# Altium project GEMAS-Guereca Entertainment Mini Arcade System.PrjPcb
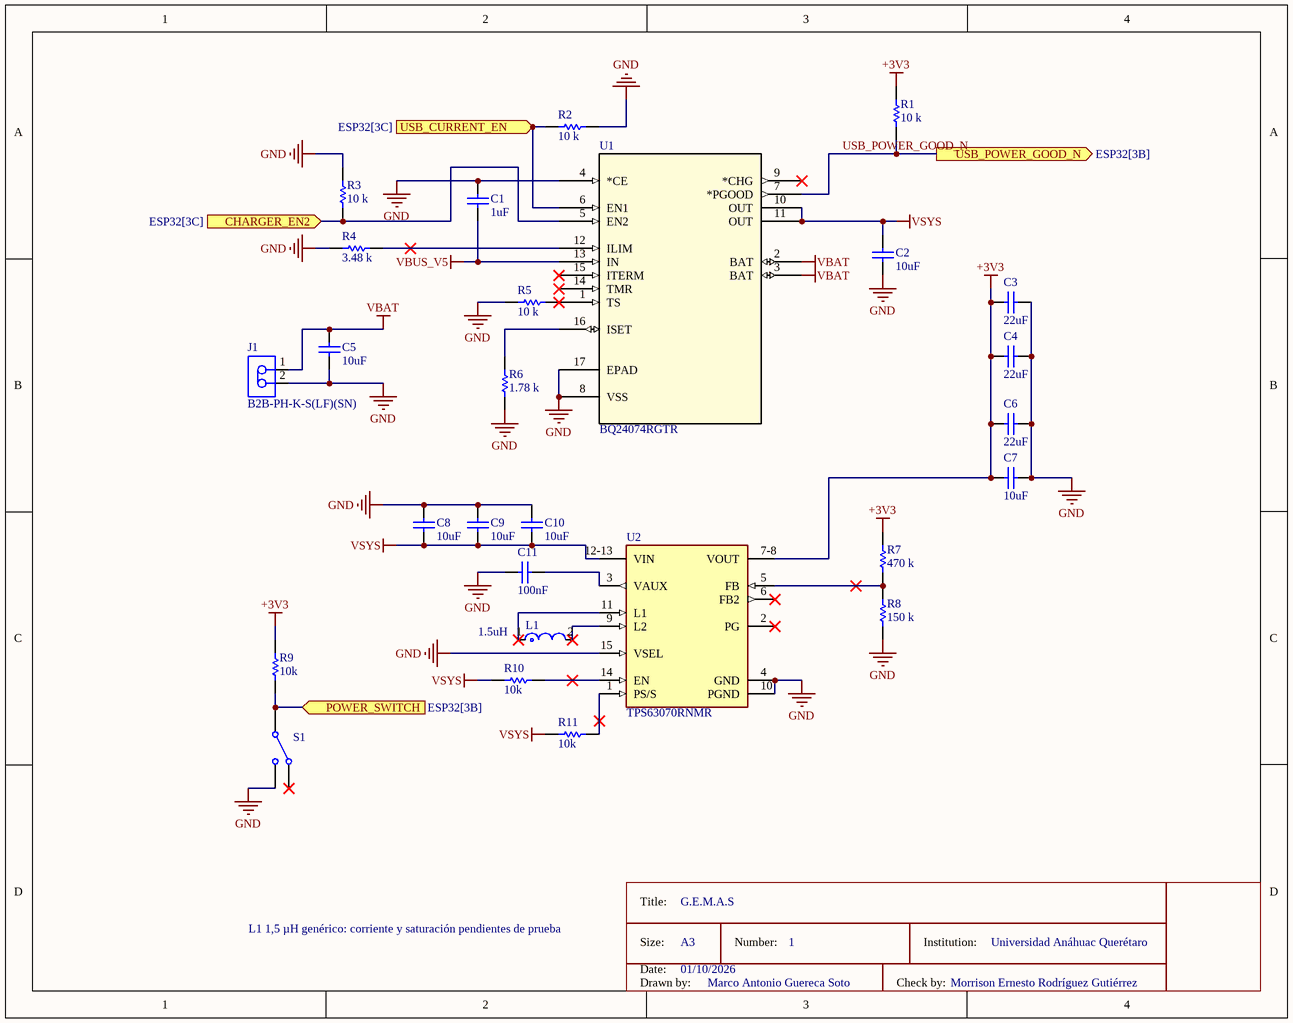
[diagram p0: Alimentacion.SchDoc]
6 sheets, 89 parts. Net scope: global (net labels, ports and power ports of the same name join across sheets).
Board files: PCB_Gemas.PcbDoc, PCB_GEMAS1.1.PcbDoc, PCB_GEMAS_V2(RevisaEsta).PcbDoc
Sheets:
  Alimentacion.SchDoc
  USB-C.SchDoc
  ESP32.SchDoc
  Pantalla_microSD.SchDoc
  Audio.SchDoc
  Controles.SchDoc

## Sheet Alimentacion.SchDoc: G.E.M.A.S
size A; Date: 01/10/2026; SheetNumber: 1; SheetTotal: 5

### Parts
C1  value 1uF  [CAP 1206_3216]  (hidden comment: Capacitor)
C2  value 10uF  [CAP 1206_3216]  (hidden comment: Capacitor)
C3  22uF  [CAP 1206_3216]
C4  22uF  [CAP 1206_3216]
C5  value 10uF  [CAP 1206_3216]  (hidden comment: Capacitor)
C6  22uF  [CAP 1206_3216]
C7  value 10uF  [CAP 1206_3216]  (hidden comment: Capacitor)
C8  value 10uF  [CAP 1206_3216]  (hidden comment: Capacitor)
C9  value 10uF  [CAP 1206_3216]  (hidden comment: Capacitor)
C10  value 10uF  [CAP 1206_3216]  (hidden comment: Capacitor)
C11  value 100nF  [CAP 1206_3216]  (hidden comment: Capacitor)
J1  B2B-PH-K-S(LF)(SN)  [JST-B2B-PH-K-S_V]
L1  1.5uH  [FP-XFL4020-MFG]
R1  value 10 k  [RES 0805_2012]  (hidden comment: Resistor)
R2  value 10 k  [RES 0805_2012]  (hidden comment: Resistor)
R3  value 10 k  [RES 0805_2012]  (hidden comment: Resistor)
R4  value 3.48 k  [RES 0805_2012]  (hidden comment: Resistor)
R5  value 10 k  [RES 0805_2012]  (hidden comment: Resistor)
R6  value 1.78 k  [RES 0805_2012]  (hidden comment: Resistor)
R7  value 470 k  [RES 0805_2012]  (hidden comment: Resistor)
R8  value 150 k  [RES 0805_2012]  (hidden comment: Resistor)
R9  value 10k  [RES 0805_2012]  (hidden comment: Resistor)
R10  value 10k  [RES 0805_2012]  (hidden comment: Resistor)
R11  value 10k  [RES 0805_2012]  (hidden comment: Resistor)
S1  Single-Pole, Double-Throw Switch  [1P2T_SS-12D00_CNK]  (value not drawn)
U1  BQ24074RGTR  [RGT16_1P7X1P7]
U2  TPS63070RNMR  [FP-RNM0015A-MFG]

### Ports
CHARGER_EN2 (in, see ESP32[3C]), POWER_SWITCH (in, see ESP32[3B]), USB_CURRENT_EN (in, see ESP32[3C]), USB_POWER_GOOD_N (out, see ESP32[3B])

### Nets
+3V3: C3.1 C4.1 C6.1 C7.1 R1.1 R7.2 R9.1 U2.7-8(VOUT)
GND: C1.2 C2.1 C3.2 C4.2 C5.1 C6.2 C7.2 C8.1 C9.1 C10.1 C11.1 J1.2 R2.1 R3.1 R4.2 R5.2 R6.2 R8.2 S1.2 U1.4(*CE) U1.8(VSS) U1.17(EPAD) U2.4(GND) U2.10(PGND) U2.15(VSEL)
VBAT: C5.2 J1.1 U1.2(BAT) U1.3(BAT)
VBUS_V5: C1.1 U1.13(IN)
VSYS: C2.2 C8.2 C9.2 C10.2 R10.1 R11.1 U1.10(OUT) U1.11(OUT) U2.12-13(VIN)
USB_POWER_GOOD_N: R1.2 U1.7(*PGOOD) ; port USB_POWER_GOOD_N
NetC11_2: C11.2 U2.3(VAUX)
NetL1_1: L1.1 U2.11(L1)
NetL1_2: L1.2 U2.9(L2)
NetR2_2: R2.2 U1.6(EN1) ; port USB_CURRENT_EN
NetR3_2: R3.2 U1.5(EN2) ; port CHARGER_EN2
NetR4_1: R4.1 U1.12(ILIM)
NetR5_1: R5.1 U1.1(TS)
NetR6_1: R6.1 U1.16(ISET)
NetR7_1: R7.1 R8.1 U2.5(FB)
NetR9_2: R9.2 S1.1 ; port POWER_SWITCH
NetR10_2: R10.2 U2.14(EN)
NetR11_2: R11.2 U2.1(PS/S)

Not connected (* = marked no-connect by the designer): S1 3*; U1 9(*CHG)* 14(TMR)* 15(ITERM)*; U2 2(PG)* 6(FB2)*

### Notes on the sheet
- L1 1,5 µH genérico: corriente y saturación pendientes de prueba
- Title:
- Date:
- Size:
- A3
- Number:
- Institution:
- Universidad Anáhuac Querétaro
- Drawn by:
- Marco Antonio Guereca Soto
- Check by:
- Morrison Ernesto Rodríguez Gutiérrez

### Library data of the parts
C1 C2 C5 C7-C11 = Capacitor: SimulationGenericComponent: True
C3 C4 C6 = Capacitor: 22F; SimulationGenericComponent: True; Value: 22uF
J1 = CMP-2000-05162-1: Male Header, Pitch 2 mm, 1 x 2 Position, Height 6 mm, Tail Length 3.4 mm, -25 to 85 degC, RoHS, Bulk; Manufacturer: JST; Pitch: 2mm; Style/Orientation: StraightHeader/Plug; No of Positions: 2; Datasheet Version: Nov-08; Datasheet URL: http://datasheet.octopart.com/B2B-PH-K-S%28LF%29%28SN%29-JST-datasheet-8324864.pdf; Manufacturer URL: http://www.jst.com/home2.html; Type: ShroudedHeader; Termination: Crimp
L1 = CMP-11268-000104-1: Inductor Power Shielded Wirewound 1.5uH 20% 100KHz 9.1A 15.8mOhm DCR 1515 Automotive Embossed Plastic T/R; Core Material: Composite; DC Resistance (DCR): 15.8mR; Saturation Current: 4.1A; Self Resonant Frequency: 59MHz; Tolerance: 20%; Inductance: 1.5uH; Max DC Current: 9.1A; RoHS Compliant: Yes; Max Operating Temperature: 125°C; Length: 4.3mm; Case/Package: SMD/SMT; Mount: Surface Mount; Shielding: Shielded; Min Operating Temperature: -40°C; RMS Current (Irms): 9.1A; Test Frequency: 100kHz; Inductance Tolerance: 20%; REACH SVHC: No SVHC; Packaging: Tape and Reel; Termination: SMD/SMT; Lead Free: Contains Lead; Width: 4.3mm; Series: XFL4020; Height: 2.1mm
R1-R11 = Resistor: TC1: 0; SimulationGenericComponent: True; TC2: 0
S1 = SPDT SW: nodeUP_closed: 1; Rclosed: 1m; Ropen: 1Meg; SimulationGenericComponent: True
U1 = BQ24074RGTR: Standalone 1-cell 1.5-A linear battery charger, Power Path, 4.2-V VBAT, 10.5-V OVP and 4.4-V VOUT 16-VQFN -40 to 85; Manufacturer_Name: Texas Instruments; Copyright: Copyright (C) 2026 Ultra Librarian. All rights reserved.; Manufacturer_Part_Number: BQ24074RGTR; RefDes: RefDes; Type: Type
U2 = CMP-04918-000409-1: IC REG BCK BST ADJ 3.6A 15VQFN; Synchronous Rectifier: Yes; Output Type: Adjustable; Output Current: 2A; Max Input Voltage: 16V; Switching Frequency: 2.4MHz; Min Output Voltage: 2.5V; Output Configuration: Positive; Min Input Voltage: 2V; Topology: Buck-Boost; Number of Outputs: 1; Max Output Voltage: 9V; Quiescent Current: 50uA; Max Operating Temperature: 125°C; Case/Package: VQFN; Number of Pins: 15; RoHS Compliant: Yes; Mount: Surface Mount; Min Operating Temperature: -40°C; Lead Free: Lead Free; Packaging: Tape and Reel

## Sheet USB-C.SchDoc
size A; SheetNumber: 2; SheetTotal: 6
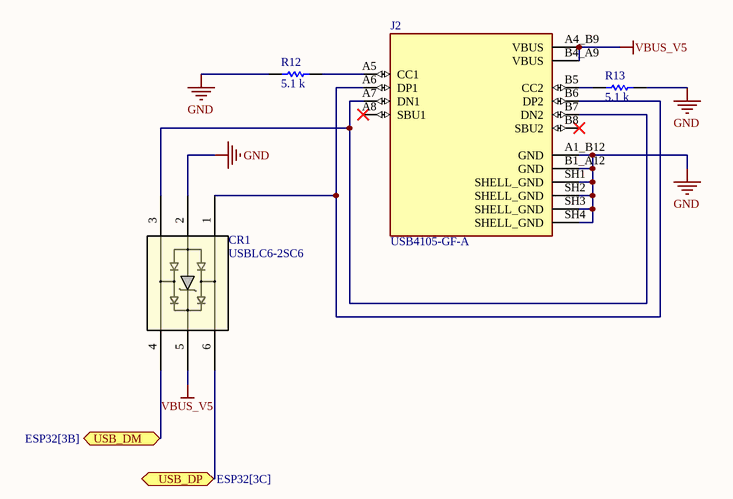
[diagram p1: USB-C.SchDoc]

### Parts
CR1  USBLC6-2SC6  [SOT23-6L_STM]
J2  USB4105-GF-A  [GCT_USB4105-GF-A]
R12  value 5.1 k  [RES 0805_2012]  (hidden comment: Resistor)
R13  value 5.1 k  [RES 0805_2012]  (hidden comment: Resistor)

### Ports
USB_DM (bidir, see ESP32[3B]), USB_DP (bidir, see ESP32[3C])

### Nets
GND: CR1.2 J2.A1_B12(GND) J2.B1_A12(GND) J2.SH1(SHELL_GND) J2.SH2(SHELL_GND) J2.SH3(SHELL_GND) J2.SH4(SHELL_GND) R12.1 R13.2
VBUS_V5: CR1.5 J2.A4_B9(VBUS) J2.B4_A9(VBUS)
NetCR1_1: CR1.1 J2.A6(DP1) J2.B6(DP2)
NetCR1_3: CR1.3 J2.A7(DN1) J2.B7(DN2)
NetCR1_4: CR1.4 ; port USB_DM
NetCR1_6: CR1.6 ; port USB_DP
NetJ2_A5: J2.A5(CC1) R12.2
NetJ2_B5: J2.B5(CC2) R13.1

Not connected (* = marked no-connect by the designer): J2 A8(SBU1)* B8(SBU2)*

### Notes on the sheet
- Title:
- Date:
- Size:
- A3
- Number:
- Institution:
- Universidad Anáhuac Querétaro
- Drawn by:
- Marco Antonio Guereca Soto
- Check by:
- Morrison Ernesto Rodríguez Gutiérrez

### Library data of the parts
CR1 = USBLC6-2SC6: ESD Protection for USB 2.0 High Speed; Manufacturer_Name: STMicroelectronics; Copyright: Copyright (C) 2025 Ultra Librarian. All rights reserved.; Manufacturer_Part_Number: USBLC6-2SC6; RefDes: RefDes; Type: Type
J2 = USB4105-GF-A: MF: {'manufacturer': u'GCT'}; Package: None; Price: None; Value: *; MP: USB4105-GF-A; Availability: Unavailable
R12 R13 = Resistor: TC1: 0; SimulationGenericComponent: True; TC2: 0

## Sheet ESP32.SchDoc
size A; SheetNumber: 3; SheetTotal: 6
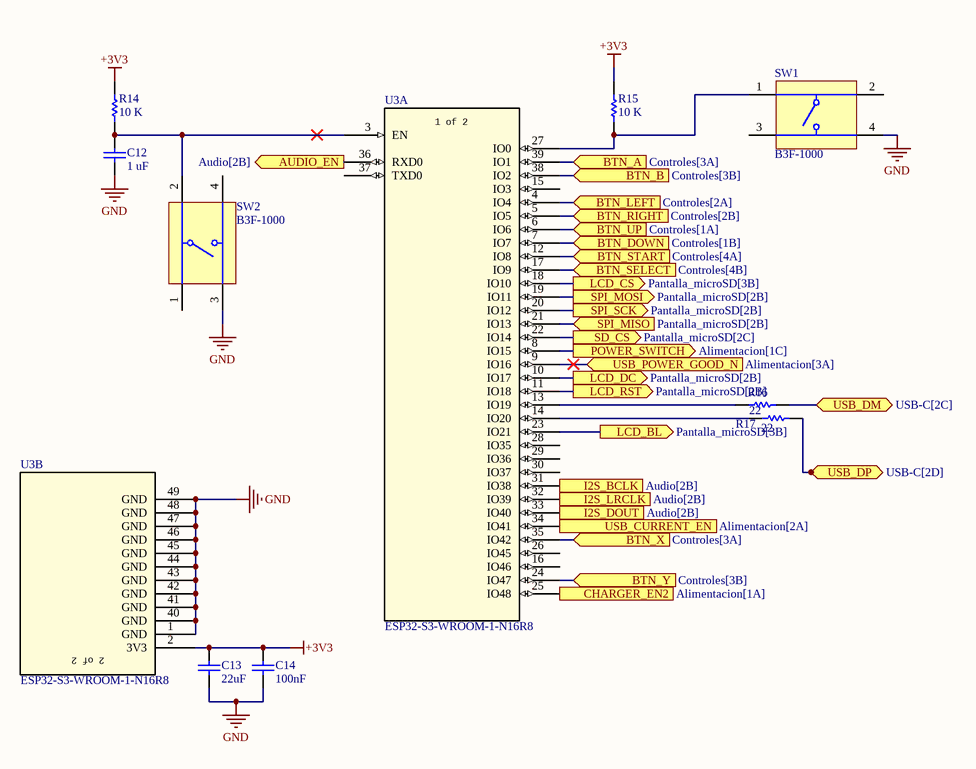
[diagram p2: ESP32.SchDoc]

### Parts
C12  1 uF  [CAP 1206_3216]
C13  value 22uF  [CAP 1206_3216]  (hidden comment: Capacitor)
C14  value 100nF  [CAP 1206_3216]  (hidden comment: Capacitor)
R14  10 k  [RES 0805_2012]
R15  10 k  [RES 0805_2012]
R16  value 22  [RES 0805_2012]  (hidden comment: Resistor)
R17  value 22  [RES 0805_2012]  (hidden comment: Resistor)
SW1  B3F-1000  [OMRON-B3F-1000-4_V]
SW2  B3F-1000  [OMRON-B3F-1000-4_V]
U3  ESP32-S3-WROOM-1-N16R8  [ESP32-S3-WROOM-1_EXP]  (parts A,B of 2)

### Ports
AUDIO_EN (out, see Audio[2B]), BTN_A (in, see Controles[3A]), BTN_B (in, see Controles[3B]), BTN_DOWN (in, see Controles[1B]), BTN_LEFT (in, see Controles[2A]), BTN_RIGHT (in, see Controles[2B]), BTN_SELECT (in, see Controles[4B]), BTN_START (in, see Controles[4A]), BTN_UP (in, see Controles[1A]), BTN_X (in, see Controles[3A]), BTN_Y (in, see Controles[3B]), CHARGER_EN2 (out, see Alimentacion[1A]), I2S_BCLK (out, see Audio[2B]), I2S_DOUT (out, see Audio[2B]), I2S_LRCLK (out, see Audio[2B]), LCD_BL (out, see Pantalla_microSD[3B]), LCD_CS (out, see Pantalla_microSD[3B]), LCD_DC (out, see Pantalla_microSD[2B]), LCD_RST (out, see Pantalla_microSD[2B]), POWER_SWITCH (out, see Alimentacion[1C]), SD_CS (out, see Pantalla_microSD[2C]), SPI_MISO (in, see Pantalla_microSD[2B]), SPI_MOSI (out, see Pantalla_microSD[2B]), SPI_SCK (out, see Pantalla_microSD[2B]), USB_CURRENT_EN (out, see Alimentacion[2A]), USB_DM (bidir, see USB-C[2C]), USB_DP (bidir, see USB-C[2D]), USB_POWER_GOOD_N (in, see Alimentacion[3A])

### Nets
+3V3: C13.2 C14.1 R14.2 R15.2 U3.2(3V3)
GND: C12.1 C13.1 C14.2 SW1.4 SW2.3 U3.1(GND) U3.40(GND) U3.41(GND) U3.42(GND) U3.43(GND) U3.44(GND) U3.45(GND) U3.46(GND) U3.47(GND) U3.48(GND) U3.49(GND)
SPI_MISO: U3.21(IO13) ; port SPI_MISO
SPI_MOSI: U3.19(IO11) ; port SPI_MOSI
SPI_SCK: U3.20(IO12) ; port SPI_SCK
USB_POWER_GOOD_N: U3.9(IO16) ; port USB_POWER_GOOD_N
NetC12_2: C12.2 R14.1 SW2.2 U3.3(EN)
NetCR1_4: R16.2 ; port USB_DM
NetCR1_6: R17.2 ; port USB_DP
NetJ3_2: U3.11(IO18) ; port LCD_RST
NetJ3_4: U3.10(IO17) ; port LCD_DC
NetJ3_5: U3.18(IO10) ; port LCD_CS
NetJ4_2: U3.22(IO14) ; port SD_CS
NetR2_2: U3.34(IO41) ; port USB_CURRENT_EN
NetR3_2: U3.25(IO48) ; port CHARGER_EN2
NetR9_2: U3.8(IO15) ; port POWER_SWITCH
NetR15_1: R15.1 SW1.1 U3.27(IO0)
NetR16_1: R16.1 U3.13(IO19)
NetR17_1: R17.1 U3.14(IO20)
NetR19_1: U3.23(IO21) ; port LCD_BL
NetR30_2: U3.36(RXD0) ; port AUDIO_EN
NetR32_1: U3.6(IO6) ; port BTN_UP
NetR33_1: U3.4(IO4) ; port BTN_LEFT
NetR34_1: U3.39(IO1) ; port BTN_A
NetR35_1: U3.35(IO42) ; port BTN_X
NetR36_1: U3.12(IO8) ; port BTN_START
NetR37_1: U3.7(IO7) ; port BTN_DOWN
NetR38_1: U3.5(IO5) ; port BTN_RIGHT
NetR39_1: U3.38(IO2) ; port BTN_B
NetR40_1: U3.24(IO47) ; port BTN_Y
NetR41_1: U3.17(IO9) ; port BTN_SELECT
NetU3_31: U3.31(IO38) ; port I2S_BCLK
NetU3_32: U3.32(IO39) ; port I2S_LRCLK
NetU3_33: U3.33(IO40) ; port I2S_DOUT

Not connected (* = marked no-connect by the designer): SW1 2 3; SW2 1 4; U3 15(IO3) 16(IO46) 26(IO45) 28(IO35) 29(IO36) 30(IO37) 37(TXD0)

### Notes on the sheet
- Title:
- Date:
- Size:
- A3
- Number:
- Institution:
- Universidad Anáhuac Querétaro
- Drawn by:
- Marco Antonio Guereca Soto
- Check by:
- Morrison Ernesto Rodríguez Gutiérrez
- (in symbol ESP32-S3-WROOM-1-N16R8, part A) 1 of 2
- (in symbol ESP32-S3-WROOM-1-N16R8, part B) 2 of 2

### Library data of the parts
C12-C14 = Capacitor: SimulationGenericComponent: True
  C12: Value: 1 uF
R14-R17 = Resistor: TC1: 0; SimulationGenericComponent: True; TC2: 0
  R14 R15: Value: 10 K
SW1 SW2 = CMP-1677-00002-1: Tactile Switch, SPST-NO, 0.05 A, 5 to 24 V, -25 to 70 degC, 4-Pin THD, RoHS, Bulk; Shielding: Shielded; Gender: Female; Capacitance: -45 f; Voltage Rating: 150 V; Current Rating: 1.5 A; Radiation Hardening: No; Contact Plating: Gold; Height: 14.99 mm; Min Operating Temperature: -40 degC; Packaging: Tray; ComponentLink2Description: Datasheet; ComponentLink1URL: http://www.omron.com/; Lead Pitch: 1.27 mm; RoHSCompliant: true; Pins: 8; PackageReference: B3F-1000; Width: 25.4 mm; Contact Material: Brass; ComponentLink2URL: http://www.omron.com/ecb/products/pdf/en-b3f.pdf; PackageDescription: 4-Pin Through Hole Device, Body 6 x 6 mm; DatasheetVersion: Jan-15; ComponentLink1Description: Manufacturer URL; Package Quantity: 1080; Mount: Through Hole; Length: 18.34 mm; Max Operating Temperature: 70 degC
U3 = ESP32-S3-WROOM-1-N16R8: Description; Manufacturer_Name: Espressif Systems; Copyright: Copyright (C) 2026 Ultra Librarian. All rights reserved.; Manufacturer_Part_Number: ESP32-S3-WROOM-1-N16R8; RefDes: RefDes; Type: Type

## Sheet Pantalla_microSD.SchDoc
size A; SheetNumber: 4; SheetTotal: 6
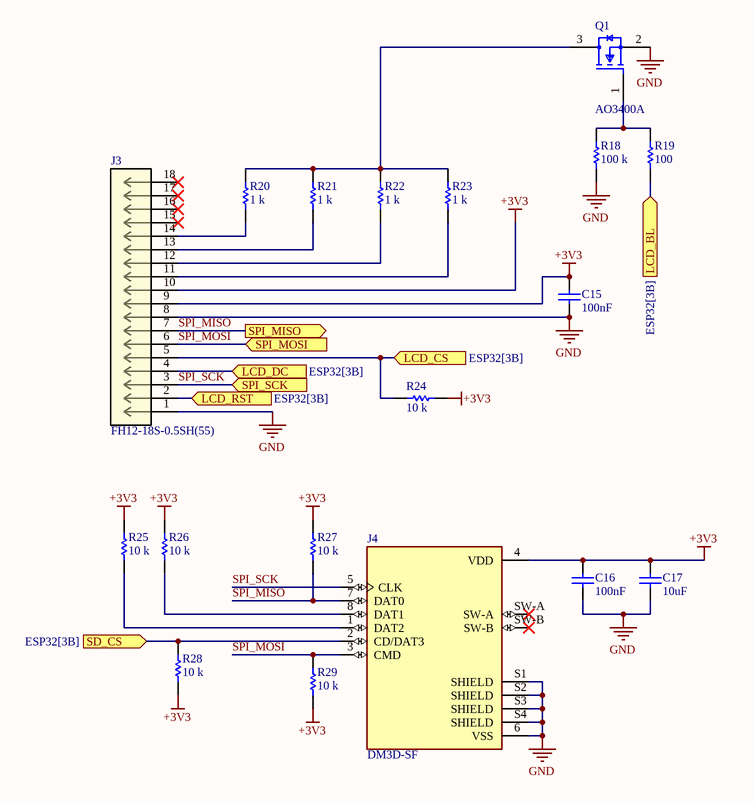
[diagram p3: Pantalla_microSD.SchDoc]

### Parts
C15  value 100nF  [CAP 1206_3216]  (hidden comment: Capacitor)
C16  value 100nF  [CAP 1206_3216]  (hidden comment: Capacitor)
C17  value 10uF  [CAP 1206_3216]  (hidden comment: Capacitor)
J3  FH12-18S-0.5SH(55)  [CONN_FH12-18S-0.5SH-55_HIR]
J4  DM3D-SF  [HRS_DM3D-SF]
Q1  AO3400A  [FP-SOT23-MFG]
R18  value 100 k  [RES 0805_2012]  (hidden comment: Resistor)
R19  value 100  [RES 0805_2012]  (hidden comment: Resistor)
R20  value 1 k  [RES 0805_2012]  (hidden comment: Resistor)
R21  value 1 k  [RES 0805_2012]  (hidden comment: Resistor)
R22  value 1 k  [RES 0805_2012]  (hidden comment: Resistor)
R23  value 1 k  [RES 0805_2012]  (hidden comment: Resistor)
R24  value 10 k  [RES 0805_2012]  (hidden comment: Resistor)
R25  value 10 k  [RES 0805_2012]  (hidden comment: Resistor)
R26  value 10 k  [RES 0805_2012]  (hidden comment: Resistor)
R27  value 10 k  [RES 0805_2012]  (hidden comment: Resistor)
R28  value 10 k  [RES 0805_2012]  (hidden comment: Resistor)
R29  value 10 k  [RES 0805_2012]  (hidden comment: Resistor)

### Ports
LCD_BL (in, see ESP32[3B]), LCD_CS (in, see ESP32[3B]), LCD_DC (in, see ESP32[3B]), LCD_RST (in, see ESP32[3B]), SD_CS (in, see ESP32[3B]), SPI_MISO (out, see ESP32[3B]), SPI_MOSI (in, see ESP32[3B]), SPI_SCK (in, see ESP32[3B])

### Nets
+3V3: C15.2 C16.2 C17.2 J3.9 J3.10 J4.4(VDD) R24.2 R25.1 R26.1 R27.2 R28.2 R29.2
GND: C15.1 C16.1 C17.1 J3.1 J3.8 J4.6(VSS) J4.S1(SHIELD) J4.S2(SHIELD) J4.S3(SHIELD) J4.S4(SHIELD) Q1.2(S) R18.1
SPI_MISO: J3.7 J4.7(DAT0) R27.1 ; port SPI_MISO
SPI_MOSI: J3.6 J4.3(CMD) R29.1 ; port SPI_MOSI
SPI_SCK: J3.3 J4.5(CLK) ; port SPI_SCK
NetJ3_2: J3.2 ; port LCD_RST
NetJ3_4: J3.4 ; port LCD_DC
NetJ3_5: J3.5 R24.1 ; port LCD_CS
NetJ3_11: J3.11 R23.1
NetJ3_12: J3.12 R22.1
NetJ3_13: J3.13 R21.1
NetJ3_14: J3.14 R20.1
NetJ4_1: J4.1(DAT2) R25.2
NetJ4_2: J4.2(CD/DAT3) R28.1 ; port SD_CS
NetJ4_8: J4.8(DAT1) R26.2
NetQ1_1: Q1.1(G) R18.2 R19.2
NetQ1_3: Q1.3(D) R20.2 R21.2 R22.2 R23.2
NetR19_1: R19.1 ; port LCD_BL

Not connected (* = marked no-connect by the designer): J3 15* 16* 17* 18*; J4 SW-A* SW-B*

### Notes on the sheet
- Title:
- Date:
- Size:
- A3
- Number:
- Institution:
- Universidad Anáhuac Querétaro
- Drawn by:
- Marco Antonio Guereca Soto
- Check by:
- Morrison Ernesto Rodríguez Gutiérrez

### Library data of the parts
C15-C17 = Capacitor: SimulationGenericComponent: True
J3 = FH12-18S-0.5SH55: Description; Manufacturer_Name: Hirose; Copyright: Copyright (C) 2026 Ultra Librarian. All rights reserved.; Manufacturer_Part_Number: FH12-18S-0.5SH(55); RefDes: RefDes; Type: Type
J4 = DM3D-SF: 10 _8 + 2_ Position Card Connector Secure Digital - microSDâ„¢ Surface Mount, Right Angle Gold; MF: Hirose Electric; MP: DM3D-SF; Package: None; Price: None; Availability: Unavailable; SnapEDA_Link: https://www.snapeda.com/parts/DM3D-SF/Hirose%20Electric%20Co%20Ltd/view-part/250106/?ref=snap; Value: *
Q1 = CMP-83955-000006-1: MOSFET N-CH 30V 5.7A SOT23; Input Capacitance: 630pF; Number of Elements: 1; Rds On Max: 26.5mR; Max Power Dissipation: 1.4W; Gate to Source Voltage (Vgs): 12V; Min Operating Temperature: -55°C; Lead Free: Lead Free; Number of Pins: 3; Drain to Source Voltage (Vdss): 30V; Case/Package: SOT-23; Mount: Surface Mount; Continuous Drain Current (ID): 5.7A; Radiation Hardening: No; Packaging: Tape and Reel; Max Operating Temperature: 150°C; Power Dissipation: 1.4W
R18-R29 = Resistor: TC1: 0; SimulationGenericComponent: True; TC2: 0

## Sheet Audio.SchDoc
size A; SheetNumber: 5; SheetTotal: 6
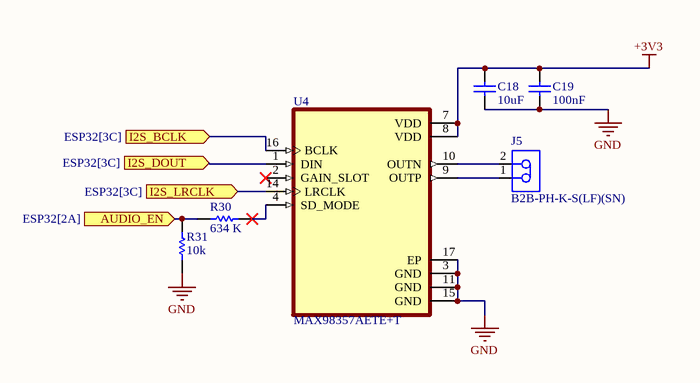
[diagram p4: Audio.SchDoc]

### Parts
C18  value 10uF  [CAP 1206_3216]  (hidden comment: Capacitor)
C19  value 100nF  [CAP 1206_3216]  (hidden comment: Capacitor)
J5  B2B-PH-K-S(LF)(SN)  [JST-B2B-PH-K-S_V]
R30  value 634 K  [RES 0805_2012]  (hidden comment: Resistor)
R31  value 10k  [RES 0805_2012]  (hidden comment: Resistor)
U4  MAX98357AETE+T  [QFN50P300X300X80-17N]

### Ports
AUDIO_EN (in, see ESP32[2A]), I2S_BCLK (in, see ESP32[3C]), I2S_DOUT (in, see ESP32[3C]), I2S_LRCLK (in, see ESP32[3C])

### Nets
+3V3: C18.2 C19.2 U4.7(VDD) U4.8(VDD)
GND: C18.1 C19.1 R31.2 U4.3(GND) U4.11(GND) U4.15(GND) U4.17(EP)
NetJ5_1: J5.1 U4.9(OUTP)
NetJ5_2: J5.2 U4.10(OUTN)
NetR30_1: R30.1 U4.4(SD_MODE)
NetR30_2: R30.2 R31.1 ; port AUDIO_EN
NetU3_31: U4.16(BCLK) ; port I2S_BCLK
NetU3_32: U4.14(LRCLK) ; port I2S_LRCLK
NetU3_33: U4.1(DIN) ; port I2S_DOUT

Not connected (* = marked no-connect by the designer): U4 2(GAIN_SLOT)*

### Notes on the sheet
- Title:
- Date:
- Size:
- A3
- Number:
- Institution:
- Universidad Anáhuac Querétaro
- Drawn by:
- Marco Antonio Guereca Soto
- Check by:
- Morrison Ernesto Rodríguez Gutiérrez

### Library data of the parts
C18 C19 = Capacitor: SimulationGenericComponent: True
J5 = CMP-2000-05162-1: as J1 on sheet Alimentacion; Datasheet Version: Nov-08; Datasheet URL: http://datasheet.octopart.com/B2B-PH-K-S%28LF%29%28SN%29-JST-datasheet-8324864.pdf; Manufacturer URL: http://www.jst.com/home2.html; Type: ShroudedHeader; Termination: Crimp
R30 R31 = Resistor: TC1: 0; SimulationGenericComponent: True; TC2: 0
U4 = MAX98357AETE+T: Tiny, Low-Cost, PCM Class D Amplifier with Class AB Performance; MF: Analog Devices; SnapEDA_Link: https://www.snapeda.com/parts/MAX98357AETE+T/Analog+Devices/view-part/?ref=snap; Package: TQFN-16 Maxim; Value: *; MP: MAX98357AETE+T; Check_prices: https://www.snapeda.com/parts/MAX98357AETE+T/Analog+Devices/view-part/?ref=eda

## Sheet Controles.SchDoc
size A; SheetNumber: 6; SheetTotal: 6
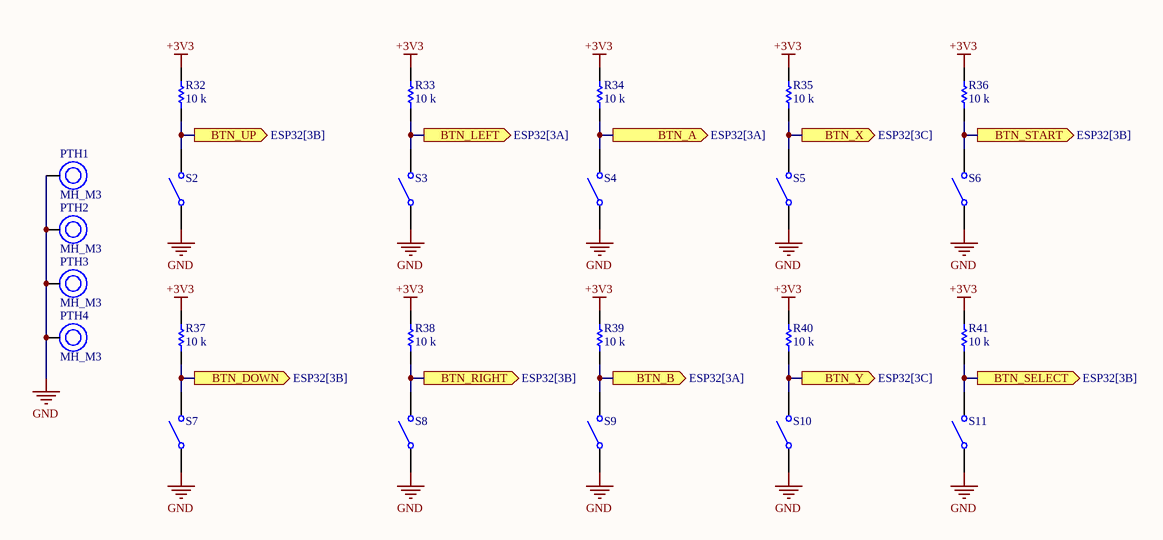
[diagram p5: Controles.SchDoc]

### Parts
PTH1  MH_M3  [PCBComponent_1]
PTH2  MH_M3  [PCBComponent_1]
PTH3  MH_M3  [PCBComponent_1]
PTH4  MH_M3  [PCBComponent_1]
R32  value 10 k  [RES 0805_2012]  (hidden comment: Resistor)
R33  value 10 k  [RES 0805_2012]  (hidden comment: Resistor)
R34  value 10 k  [RES 0805_2012]  (hidden comment: Resistor)
R35  value 10 k  [RES 0805_2012]  (hidden comment: Resistor)
R36  value 10 k  [RES 0805_2012]  (hidden comment: Resistor)
R37  value 10 k  [RES 0805_2012]  (hidden comment: Resistor)
R38  value 10 k  [RES 0805_2012]  (hidden comment: Resistor)
R39  value 10 k  [RES 0805_2012]  (hidden comment: Resistor)
R40  value 10 k  [RES 0805_2012]  (hidden comment: Resistor)
R41  value 10 k  [RES 0805_2012]  (hidden comment: Resistor)
S2  Single-Pole, Single-Throw Switch  [SNES_BTN_soft+mech_5mm_0.3_0.3]  (value not drawn)
S3  Single-Pole, Single-Throw Switch  [SNES_BTN_soft+mech_5mm_0.3_0.3]  (value not drawn)
S4  Single-Pole, Single-Throw Switch  [SNES_BTN_soft+mech_5mm_0.3_0.3]  (value not drawn)
S5  Single-Pole, Single-Throw Switch  [SNES_BTN_soft+mech_5mm_0.3_0.3]  (value not drawn)
S6  Single-Pole, Single-Throw Switch  [SNES_BTN_soft+mech_5mm_0.3_0.3]  (value not drawn)
S7  Single-Pole, Single-Throw Switch  [SNES_BTN_soft+mech_5mm_0.3_0.3]  (value not drawn)
S8  Single-Pole, Single-Throw Switch  [SNES_BTN_soft+mech_5mm_0.3_0.3]  (value not drawn)
S9  Single-Pole, Single-Throw Switch  [SNES_BTN_soft+mech_5mm_0.3_0.3]  (value not drawn)
S10  Single-Pole, Single-Throw Switch  [SNES_BTN_soft+mech_5mm_0.3_0.3]  (value not drawn)
S11  Single-Pole, Single-Throw Switch  [SNES_BTN_soft+mech_5mm_0.3_0.3]  (value not drawn)

### Ports
BTN_A (out, see ESP32[3A]), BTN_B (out, see ESP32[3A]), BTN_DOWN (out, see ESP32[3B]), BTN_LEFT (out, see ESP32[3A]), BTN_RIGHT (out, see ESP32[3B]), BTN_SELECT (out, see ESP32[3B]), BTN_START (out, see ESP32[3B]), BTN_UP (out, see ESP32[3B]), BTN_X (out, see ESP32[3C]), BTN_Y (out, see ESP32[3C])

### Nets
+3V3: R32.2 R33.2 R34.2 R35.2 R36.2 R37.2 R38.2 R39.2 R40.2 R41.2
GND: PTH1.1 PTH2.1 PTH3.1 PTH4.1 S2.1 S3.1 S4.1 S5.1 S6.1 S7.1 S8.1 S9.1 S10.1 S11.1
NetR32_1: R32.1 S2.2 ; port BTN_UP
NetR33_1: R33.1 S3.2 ; port BTN_LEFT
NetR34_1: R34.1 S4.2 ; port BTN_A
NetR35_1: R35.1 S5.2 ; port BTN_X
NetR36_1: R36.1 S6.2 ; port BTN_START
NetR37_1: R37.1 S7.2 ; port BTN_DOWN
NetR38_1: R38.1 S8.2 ; port BTN_RIGHT
NetR39_1: R39.1 S9.2 ; port BTN_B
NetR40_1: R40.1 S10.2 ; port BTN_Y
NetR41_1: R41.1 S11.2 ; port BTN_SELECT

### Notes on the sheet
- Title:
- Date:
- Size:
- A3
- Number:
- Institution:
- Universidad Anáhuac Querétaro
- Drawn by:
- Marco Antonio Guereca Soto
- Check by:
- Morrison Ernesto Rodríguez Gutiérrez

### Library data of the parts
R32-R41 = Resistor: TC1: 0; SimulationGenericComponent: True; TC2: 0
S2-S11 = SPST SW: closed: 0; Rclosed: 1m; Ropen: 1Meg; SimulationGenericComponent: True

## Nets that join several sheets
+3V3: Alimentacion (8 pins), ESP32 (5 pins), Pantalla_microSD (12 pins), Audio (C18.2 C19.2 U4.7 U4.8), Controles (10 pins)
GND: Alimentacion (25 pins), USB-C (9 pins), ESP32 (16 pins), Pantalla_microSD (12 pins), Audio (7 pins), Controles (14 pins)
VBUS_V5: Alimentacion (C1.1 U1.13), USB-C (CR1.5 J2.A4_B9 J2.B4_A9)
NetCR1_4: USB-C (CR1.4), ESP32 (R16.2)
NetCR1_6: USB-C (CR1.6), ESP32 (R17.2)
NetJ3_2: ESP32 (U3.11), Pantalla_microSD (J3.2)
NetJ3_4: ESP32 (U3.10), Pantalla_microSD (J3.4)
NetJ3_5: ESP32 (U3.18), Pantalla_microSD (J3.5 R24.1)
NetJ4_2: ESP32 (U3.22), Pantalla_microSD (J4.2 R28.1)
NetR2_2: Alimentacion (R2.2 U1.6), ESP32 (U3.34)
NetR3_2: Alimentacion (R3.2 U1.5), ESP32 (U3.25)
NetR9_2: Alimentacion (R9.2 S1.1), ESP32 (U3.8)
NetR19_1: ESP32 (U3.23), Pantalla_microSD (R19.1)
NetR30_2: ESP32 (U3.36), Audio (R30.2 R31.1)
NetR32_1: ESP32 (U3.6), Controles (R32.1 S2.2)
NetR33_1: ESP32 (U3.4), Controles (R33.1 S3.2)
NetR34_1: ESP32 (U3.39), Controles (R34.1 S4.2)
NetR35_1: ESP32 (U3.35), Controles (R35.1 S5.2)
NetR36_1: ESP32 (U3.12), Controles (R36.1 S6.2)
NetR37_1: ESP32 (U3.7), Controles (R37.1 S7.2)
NetR38_1: ESP32 (U3.5), Controles (R38.1 S8.2)
NetR39_1: ESP32 (U3.38), Controles (R39.1 S9.2)
NetR40_1: ESP32 (U3.24), Controles (R40.1 S10.2)
NetR41_1: ESP32 (U3.17), Controles (R41.1 S11.2)
NetU3_31: ESP32 (U3.31), Audio (U4.16)
NetU3_32: ESP32 (U3.32), Audio (U4.14)
NetU3_33: ESP32 (U3.33), Audio (U4.1)
SPI_MISO: ESP32 (U3.21), Pantalla_microSD (J3.7 J4.7 R27.1)
SPI_MOSI: ESP32 (U3.19), Pantalla_microSD (J3.6 J4.3 R29.1)
SPI_SCK: ESP32 (U3.20), Pantalla_microSD (J3.3 J4.5)
USB_POWER_GOOD_N: Alimentacion (R1.2 U1.7), ESP32 (U3.9)